# Altium schematic sheet Power_connectors.SchDoc: Power connectors and power LEDs
size A4; DocumentNumber: ADC-SCH-18; SheetNumber: 18; SheetTotal: 20
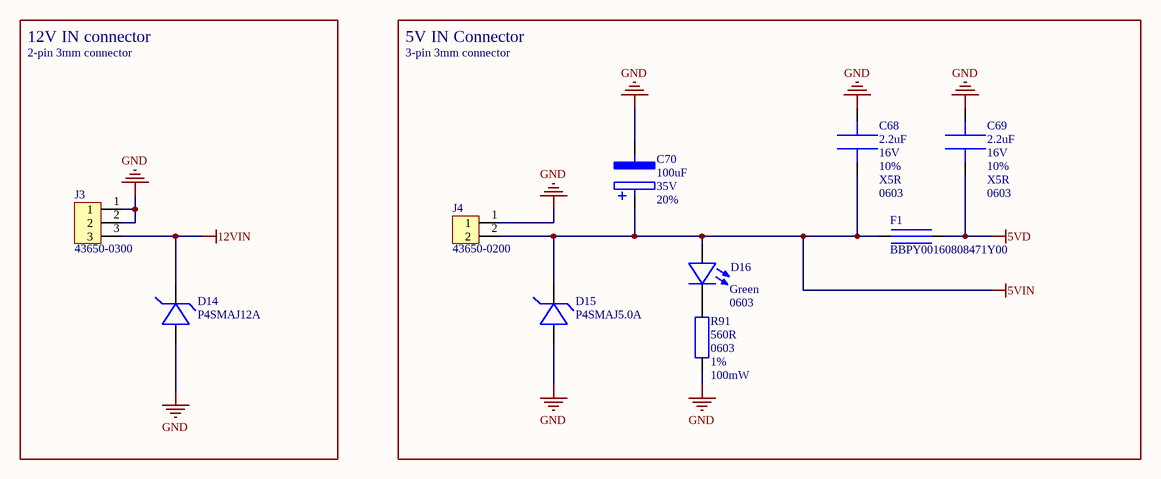
[diagram p0: Power_connectors.SchDoc]

## Parts
C68  value 2.2uF  Voltage: 16V  Tolerance: 10%  Dielectric: X5R  Package: 0603  [CAPC_0603]  (hidden comment: C0603C225K4PAC)
C69  value 2.2uF  Voltage: 16V  Tolerance: 10%  Dielectric: X5R  Package: 0603  [CAPC_0603]  (hidden comment: C0603C225K4PAC)
C70  value 100uF  Voltage: 35V  Tolerance: 20%  [CAPE_6.3R_7.7H]  (hidden comment: EDK107M035S9HAA)
D14  P4SMAJ12A  [DIOC_DO-214AC]
D15  P4SMAJ5.0A  [DIOC_DO-214AC]
D16  package: 0603  color: Green  [DIOC_0603_LED]  (hidden comment: KG EELP41.22-PHRH-35-A8J8-20-R18)
F1  BBPY00160808471Y00  [FERC_0603]
J3  43650-0300  [CONT_43650-0300]
J4  43650-0200  [CONT_43650-0200]
R91  value 560R  Package: 0603  Tolerance: 1%  Power: 100mW  [RESC_0603]  (hidden comment: RC0603FR-07560RL)

## Blocks framed on the sheet
12V IN connector: D14 J3
5V IN Connector: C68-C70 D15 D16 F1 J4 R91

## Nets
5VD: C69.2 F1.1
5VIN: C68.2 C70.1 D15.2 D16.1 F1.2 J4.2
12VIN: D14.2 J3.3
GND: C68.1 C69.1 C70.2 D14.1 D15.1 J3.1 J3.2 J4.1 R91.2
NetD16_2: D16.2 R91.1

## Notes on the sheet
- 2-pin 3mm connector
- 3-pin 3mm connector
- Drawn by
- Approved by
- Document type
- Date of issue
- Legal owner
- Title
- Circuit diagram
- File
- AGH Marines
- Document no.
- Revision
- Status
- Sheet
- Size
- Lang.
- /
- A4
- EN

## Library data of the parts
C68 C69 = C0603C225K4PAC: Multilayer Ceramic Capacitors MLCC - SMD/SMT 16V 2.2uF X5R 0603 10%; Manufacturer: KEMET; Supplier 1: Mouser; Supplier Part Number 1: 80-C0603C225K4PAC
C70 = EDK107M035S9HAA: Aluminum Electrolytic Capacitors - SMD 35V 100uF AEC-Q200 20% 85C/2K Hours; Manufacturer: KEMET; Package: 6.3x7.7; Supplier 1: Mouser; Supplier Part Number 1: 80-EDK107M035S9HAA
D14 = P4SMAJ12A: ESD Protection Diodes / TVS Diodes TVS, SMA, 150C, 400W, Unidir; Manufacturer: Diotec Semiconductor; Breakdown voltage: 12V; Package: DO-214AC-2; Supplier 1: Mouser; Supplier Part Number 1: 637-P4SMAJ12A
D15 = P4SMAJ5.0A: ESD Protection Diodes / TVS Diodes TVS, SMA, 150C, 400W, Unidir; Manufacturer: Diotec Semiconductor; Breakdown voltage: 5V; Package: DO-214AC-2; Supplier 1: Mouser; Supplier Part Number 1: 637-P4SMAJ5.0A
D16 = KG EELP41.22-PHRH-35-A8J8-20-R18: Single Color LEDs; Supplier 1: Mouser; Supplier Part Number 1: 720-P4122PHRH35A8J82
F1 = BBPY00160808471Y00: Ferrite Beads 470Ohms RDC=0.15Ohms 1500mA; Manufacturer: Pulse Electronics; Package: 0603; Supplier 1: Mouser; Supplier Part Number 1: 603-BBPY160808471Y00
J3 = 43650-0300: Headers & Wire Housings R/A HEADER 3 POS TIN SINGLE ROW; Manufacturer: Molex; Pin number: 3; Supplier 1: Mouser; Supplier Part Number 1: 538-43650-0300
J4 = 43650-0200: Nr Mouser: / 538-43650-0200 / Nr prod.: / 43650-0200 / Produc.: / Molex / Nr klienta: / Nr klienta / Opis: / Headers & Wire Housings R/A HEADER 2 POS TIN SINGLE ROW; Pin number: 2; Manufacturer: Molex; Supplier 1: Mouser; Supplier Part Number 1: 538-43650-0200
R91 = RC0603FR-07560RL: Thick Film Resistors - SMD General Purpose Chip Resistor 0603, 560Ohms, 1%, 1/10W; Manufacturer: YAGEO; Supplier 1: Mouser; Supplier Part Number 1: 603-RC0603FR-07560RL